# EasyEDA Pro project RUSH_PCB_roteada.epro

# Schematic Schematic1
Board Name: Board1; Create Date: 2026-11-04; Page Name: P1; Project Name: RUSH - corrigido; Schematic Name: Schematic1; Update Date: 2026-11-06; Company: EasyEDA.com; Drawn: Erick; Page Size: A4; Version: V1.0
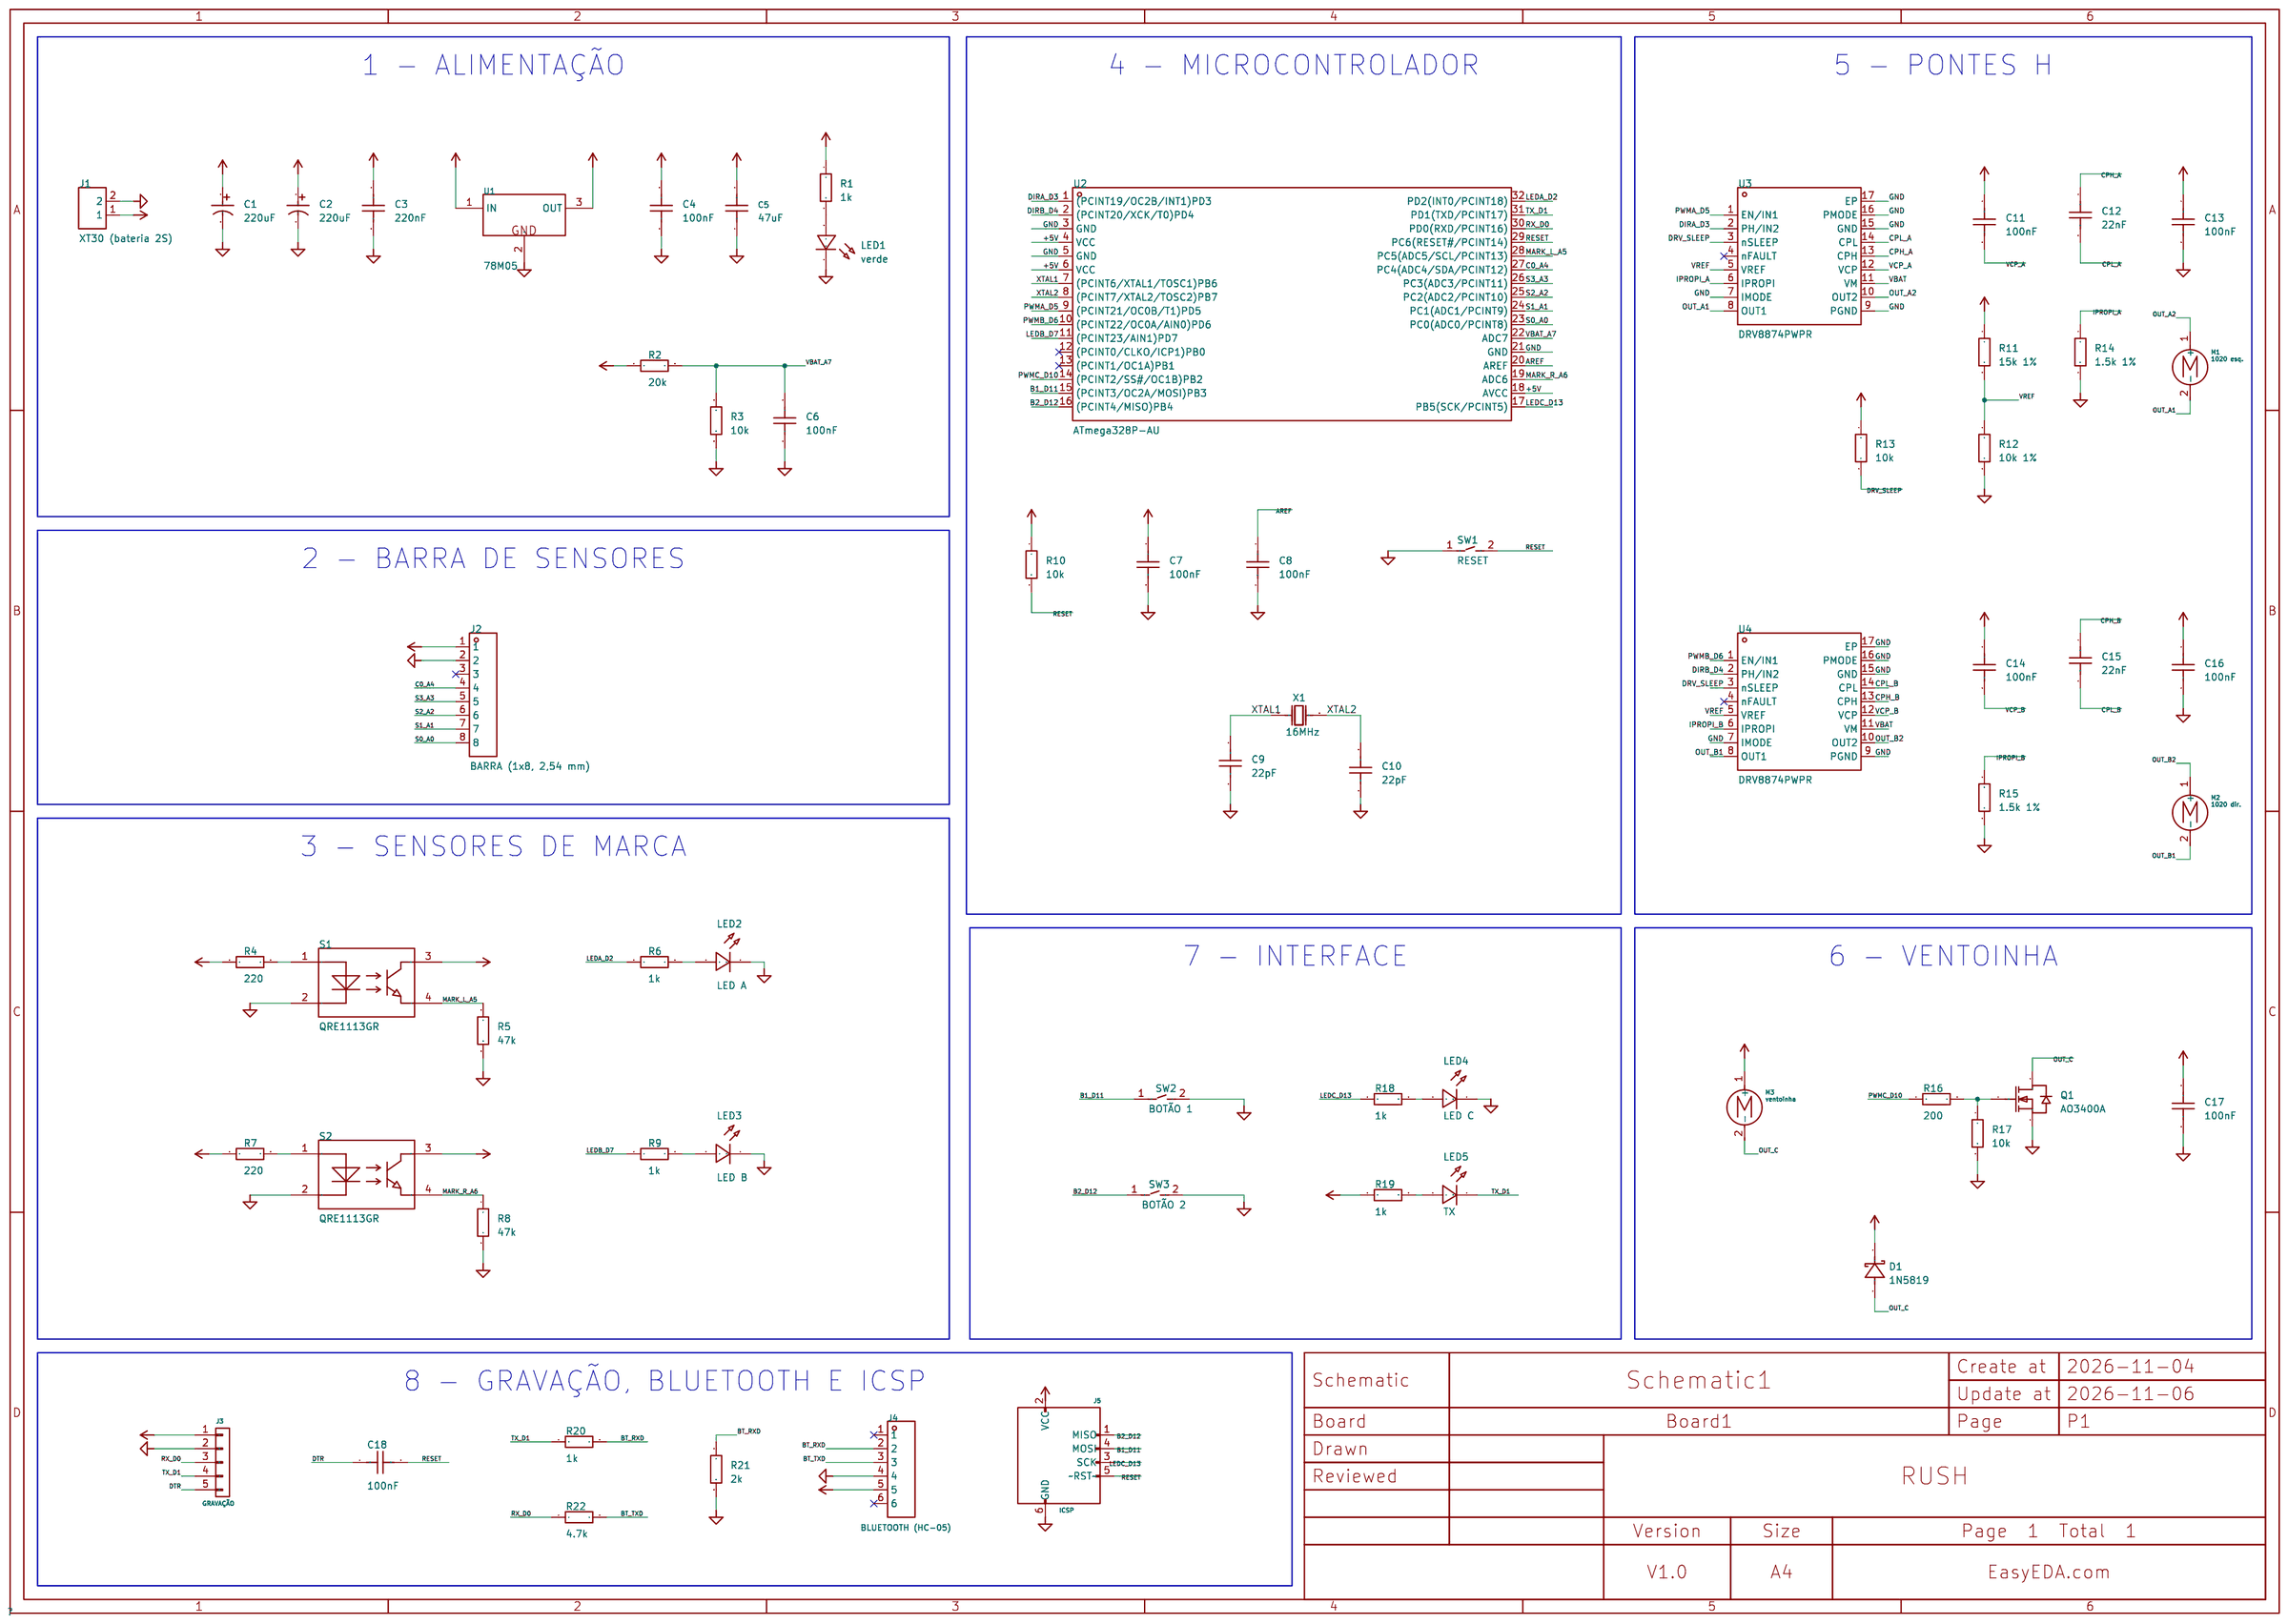
[diagram p0: schematic sheet]

## Parts
C1  220uF  [CAP-TH_BD6.3-P2.50-D1.0-FD]
C2  220uF  [CAP-TH_BD6.3-P2.50-D1.0-FD]
C3  220nF  [C0603]
C4  100nF  [C0603]
C5  47uF  [C1210]
C6  100nF  [C0603]
C7  100nF  [C0603]
C8  100nF  [C0603]
C9  22pF  [C0603]
C10  22pF  [C0603]
C11  100nF  [C0603]
C12  22nF  [C0603]
C13  100nF  [C0603]
C14  100nF  [C0603]
C15  22nF  [C0603]
C16  100nF  [C0603]
C17  100nF  [C0603]
C18  100nF  [C0603]
D1  1N5819  [SOD-123_L2.7-W1.6-LS3.7-RD-1]
J1  XT30 (bateria 2S)  [CONN-TH_XT30U-M]
J2  BARRA (1x8, 2,54 mm)  [HDR-TH_8P-P2.54-V-M]
J3  GRAVAÇÃO  [seguidor_alpha:HDR_1x05_P2.54_SMD_DEITADA]
J4  BLUETOOTH (femea 1x6, ordem HC-05)  [HDR-TH_6P-P2.54-V-F]
J5  ICSP  [seguidor_alpha:ICSP_6P_SMD_BOT]
LED1  verde  [LED0603-RD_GREEN]
LED2  LED A  [LED0603-RD_GREEN]
LED3  LED B  [LED0603-RD_GREEN]
LED4  LED C  [LED0603-RD_GREEN]
LED5  TX  [LED0603-RD_GREEN]
M1  1020 esq.  [seguidor_alpha:MOTOR_1020_2P]
M2  1020 dir.  [seguidor_alpha:MOTOR_1020_2P]
M3  ventoinha  [seguidor_alpha:MOTOR_1020_2P]
Q1  AO3400A  [SOT-23-3_L2.9-W1.3-P1.90-LS2.4-BR]
R1  1k  [R0603]
R2  20k 1%  [R0603]
R3  10k 1%  [R0603]
R4  220  [R0603]
R5  47k  [R0603]
R6  1k  [R0603]
R7  220  [R0603]
R8  47k  [R0603]
R9  1k  [R0603]
R10  10k  [R0603]
R11  15k 1%  [R0603]
R12  10k 1%  [R0603]
R13  10k  [R0603]
R14  1.5k 1%  [R0603]
R15  1.5k 1%  [R0603]
R16  200  [R0603]
R17  10k  [R0603]
R18  1k  [R0603]
R19  1k  [R0603]
R20  1k  [R0603]
R21  2k  [R0603]
R22  4.7k  [R0603]
S1  QRE1113GR  [OPTO-SMD_QRE1113GR]
S2  QRE1113GR  [OPTO-SMD_QRE1113GR]
SW1  RESET  [KEY-SMD_L6.1-W3.7-LS8.0-2]
SW2  BOTÃO 1  [KEY-SMD_L6.1-W3.7-LS8.0-2]
SW3  BOTÃO 2  [KEY-SMD_L6.1-W3.7-LS8.0-2]
U1  78M05  [TO-252-2_L6.5-W6.1-P4.58-LS10.0-TL]
U2  ATmega328P-AU  [TQFP-32_L7.0-W7.0-P0.80-LS9.0-BL]
U3  DRV8874PWPR  [HTSSOP-16_L5.0-W4.4-P0.65-LS6.4-BL-EP]
U4  DRV8874PWPR  [HTSSOP-16_L5.0-W4.4-P0.65-LS6.4-BL-EP]
X1  16MHz  [CRYSTAL-SMD_L5.0-W3.2]

## Library data of the parts
C1 C2 = KM221M025E110A: entre os pes da carcaca, como no EVA-RT; LCSC Part Name: 220uF ±20% 25V; Supplier Part: C59416; Manufacturer: CapXon(丰宾); Supplier Footprint: 插件,D6.3xL11mm; JLCPCB Part Class: Extended Part; Datasheet: https://item.szlcsc.com/datasheet/KM221M025E110A/60469.html; Supplier: LCSC; Tolerance: ±20%; Voltage Rating: 25V; Ripple Current: 235mA@120Hz; Pin Spacing: 2.5mm; Diameter: 6.3mm; Height - Seated (Max): 11mm; Lifetime: 2000hrs@105℃; Operating Temperature: -40℃~+105℃; Polarity type: Polarized; Encapsulamento: eletrolitico 25 V, radial D6,3 mm P2,5; DNP: no
C3 = CAP_0603: Supplier Footprint: 0603; Encapsulamento: 0603 50 V; DNP: no; Voltage Rating: 50V
C4 C9 C10 = CAP_0603: Supplier Footprint: 0603; Encapsulamento: 0603; DNP: no; Voltage Rating: 16V
C5 = GRM32ER61A476KE20L: Capacitance:47uF Tolerance:±10% Tolerance:±10% Voltage Rating:10V Temperature Coefficient:X5R; LCSC Part Name: 47uF ±10% 10V; Supplier Part: C397312; Manufacturer: muRata(村田); Supplier Footprint: 1210; JLCPCB Part Class: Extended Part; Datasheet: https://item.szlcsc.com/datasheet/GRM32ER61A476KE20L/378872.html; Supplier: LCSC; Tolerance: ±10%; Voltage Rating: 10V; Temperature Coefficient: X5R
C6 = CAP_0603: filtro da medicao (opcional); Supplier Footprint: 0603; Encapsulamento: 0603; DNP: no; Voltage Rating: 16V
C7 = CAP_0603: junto aos pinos VCC; Supplier Footprint: 0603; Encapsulamento: 0603; DNP: no; Voltage Rating: 16V
C8 = CAP_0603: AREF (referencia = AVCC no firmware); Supplier Footprint: 0603; Encapsulamento: 0603; DNP: no; Voltage Rating: 16V
C11 C14 = CAP_0603: VCP -> VM; Supplier Footprint: 0603; Encapsulamento: 0603 16 V X7R; DNP: no; Voltage Rating: 16V
C12 C15 = CAP_0603: CPH -> CPL (tensao >= VM); Supplier Footprint: 0603; Encapsulamento: 0603 50 V X7R; DNP: no; Voltage Rating: 50V
C13 C16 = CAP_0603: VM, junto ao pino 11; Supplier Footprint: 0603; Encapsulamento: 0603 25 V X7R; DNP: no; Voltage Rating: 25V
C17 = CAP_0603: Supplier Footprint: 0603; Encapsulamento: 0603 25 V; DNP: no; Voltage Rating: 25V
C18 = CAP_0603: reset automatico pelo DTR; Supplier Footprint: 0603; Encapsulamento: 0603; DNP: no; Voltage Rating: 16V
D1 = 1N5819HW: diodo de roda livre (novo; o EVA-RT nao tem); LCSC Part Name: 电压:40V 电流:1A; Supplier Part: C2905649; Manufacturer: TECH PUBLIC(台舟); Supplier Footprint: SOD-123; JLCPCB Part Class: Extended Part; Datasheet: https://item.szlcsc.com/datasheet/1N5819HW/3175946.html; Supplier: LCSC; Voltage - Forward(Vf@If): 900mV@3A; Voltage - DC Reverse(Vr): 40V; Current - Rectified: 1A; Reverse Leakage Current (Ir): 1mA@40V; Non-Repetitive Peak Forward Surge Current: 9A; Encapsulamento: SOD-123 (B5819W) ou 1N5819 nos terminais do motor; DNP: no
J1 = XT30U-M.G.B: pino 1 = +, pino 2 = -; LCSC Part Name: AMASS(艾迈斯)模插头锂电池插头电机控制器充电器电池接头连接器焊接 2芯锂电插头 黑色 公头15AXT30U-M.G.B; Supplier Part: C19268020; Manufacturer: AMASS(艾迈斯); JLCPCB Part Class: Extended Part; Datasheet: https://item.szlcsc.com/datasheet/XT30U-M.G.B/20526031.html; Supplier: LCSC; Encapsulamento: XT30PW-M de placa ou rabicho XT30; DNP: no
J2 = 2.54-1*8: Pin Structure:1x8P Pitch:2.54mm Circluar Pins/Square Pins:Pin Header Mounting Type:Through Hole Number of Rows:1 Number of Pins:8P Current Rating:2.5A Length of Mating Pin:6mm Insulation Height:2.54mm Length of End Connection Pin:3mm Contact Material:Bras; LCSC Part Name: 1x8P 间距:2.54mm 方针 直插; Supplier Part: C5156616; Manufacturer: ZHOURI(洲日); Supplier Footprint: 插件,P=2.54mm; JLCPCB Part Class: Extended Part; Datasheet: https://item.szlcsc.com/datasheet/2.54-1*8/5790716.html; Supplier: LCSC; Pin Structure: 1x8P; Pitch: 2.54mm; Circluar Pins/Square Pins: Pin Header; Mounting Type: Through Hole; Number of Rows: 1; Number of Pins: 8P; Current Rating: 2.5A; Length of Mating Pin: 6mm; Insulation Height: 2.54mm; Length of End Connection Pin: 3mm; Contact Material: Brass; Contact Plating: Gold; Operating Temperature: -40℃~+105℃; Encapsulamento: barra de pinos 1x8 2,54 mm; DNP: no
J3 = Connector_Generic_Conn_01x05: 1=+5V, 2=GND, 3=RX_D0, 4=TX_D1, 5=DTR. Face inferior no layout.; Encapsulamento: 5 pads SMD, passo 2,54 mm; montagem na face inferior; DNP: no
J4 = 2.54-1*6P母: frente direita, x = 32,5; HC-06 nas vias 2-5 (virado); LCSC Part Name: 1x6P 间距:2.54mm 直插; Supplier Part: C40877; Manufacturer: BOOMELE(博穆精密); Supplier Footprint: 插件,P=2.54mm; JLCPCB Part Class: Extended Part; Datasheet: https://item.szlcsc.com/datasheet/2.54-1*6P%25E6%25AF%258D/41861.html; Supplier: LCSC; Holes Structure: 1x6P; Pitch: 2.54mm; Circular Hole / Square Hole: Square Hole; Mounting Type: Through Hole; Number of Rows: 1; Number of Positions: 6P; Current Rating: 3A; Holes Direction: Top; Insulation Height: 8.5mm; Contact Material: Brass; Contact Plating: Gold; Operating Temperature: -40℃~+105℃; PIN Length: 3.2mm; Encapsulamento: barra femea 1x6 2,54 mm; DNP: no
J5 = Connector_AVR-ISP-6: posicoes do EVA-RT: x 33,97/36,51; y -8,36/-10,90/-13,44; Encapsulamento: 6 pads SMD D1,8 em grade 2,54; DNP: no
LED1 = LED_0603-G: indica 5 V presente; Encapsulamento: 0603; DNP: no
LED2 LED3 LED5 = LED_0603-G: Encapsulamento: 0603; DNP: no
LED4 = LED_0603-G: vermelho; o LED3 em paralelo do EVA-RT foi retirado; Encapsulamento: 0603; DNP: no
M1 M2 = Motor_Motor_DC: coreless 1020 7,4 V; se girar ao contrario, inverta os fios; Encapsulamento: 2 pads; DNP: no
M3 = Motor_Motor_DC: coreless 1020 7,4 V; Encapsulamento: 2 pads; DNP: no
Q1 = AO3400A_C20917: no lugar do IRFR3411/RM10N100LD; liga totalmente com 5 V no gate; LCSC Part Name: N沟道 耐压:30V; Supplier Part: C20917; Manufacturer: AOS; Supplier Footprint: SOT-23; JLCPCB Part Class: Basic Part; Datasheet: https://item.szlcsc.com/datasheet/AO3400A/21629.html; Supplier: LCSC; Number: 1 N-channel; Drain to Source Voltage: 30V; Current - Continuous Drain(Id): 5.7A; RDS(on): 48mΩ@2.5V; Pd - Power Dissipation: 1.4W; Gate Threshold Voltage (Vgs(th)): 1.45V; Gate Charge(Qg): 7nC@10V; Input Capacitance(Ciss): 630pF; Reverse Transfer Capacitance (Crss@Vds): 50pF; Operating Temperature: -55℃~+150℃; Type: N-Channel; Output Capacitance(Coss): 75pF; Vgs: ±12V; Encapsulamento: SOT-23 (1 = G, 2 = S, 3 = D); DNP: no
R1 R4-R9 R18 R19 = Res_0603: Supplier Footprint: 0603; Encapsulamento: 0603; DNP: no
R2 R3 = Res_0603: medicao da bateria (opcional); Supplier Footprint: 0603; Encapsulamento: 0603; DNP: no
R10 = Res_0603: EVA-RT usava 1k; 10k com reset automatico por DTR; Supplier Footprint: 0603; Encapsulamento: 0603; DNP: no
R11 R12 = Res_0603: VREF = 2,0 V; Supplier Footprint: 0603; Encapsulamento: 0603; DNP: no
R13 = Res_0603: nSLEEP sempre alto (pull-down interno de 100k); Supplier Footprint: 0603; Encapsulamento: 0603; DNP: no
R14 R15 = Res_0603: IPROPI -> limite de corrente; Supplier Footprint: 0603; Encapsulamento: 0603; DNP: no
R16 = Res_0603: gate; Supplier Footprint: 0603; Encapsulamento: 0603; DNP: no
R17 = Res_0603: gate -> GND (desligado no boot); Supplier Footprint: 0603; Encapsulamento: 0603; DNP: no
R20 R21 = Res_0603: divisor 5 V -> 3,3 V; Supplier Footprint: 0603; Encapsulamento: 0603; DNP: no
R22 = Res_0603: 4,7k: grava com o HC-05 encaixado (sem LED de RX); Supplier Footprint: 0603; Encapsulamento: 0603; DNP: no
S1 S2 = QRE1113GR: datasheet: 1 = anodo, 2 = catodo, 3 = coletor, 4 = emissor; LCSC Part Name: 微型反射式物体传感器; Supplier Part: C232862; Manufacturer: onsemi(安森美); Supplier Footprint: SMD-4P; JLCPCB Part Class: Extended Part; Datasheet: https://item.szlcsc.com/datasheet/QRE1113GR/232660.html; Supplier: LCSC; Sensing Distance: 1mm; Voltage - Forward(Vf): 1.2V; C-E Saturation Voltage: 30V; Current - Collector(Ic): 20mA; Reverse Pressure (Typ): 5V; Forward Current(If): 50mA; Wavelength: 940nm; Output Type: Phototransistor; Vce Saturation(VCE(sat)): 0.3V@If=20mA,Ic=50uA; Rise time: 20us@Vcc=5V,Ic=100uA,Rl=1kΩ; Fall time: 20us@Vcc=5V,Ic=100uA,Rl=1kΩ; Power Dissipation(Pd): 50mW; Operating Temperature: -40℃~+85℃; Encapsulamento: SMD 4 pinos; DNP: no
SW1-SW3 = TVBM17-025CF-R: Circuit:SPST Actuator Style:Rectangular Button Mounting Type:Surface Mount,Vertical Length:6.1mm Width:3.7mm Switch Height:2.5mm with Bracket:Without Bracket Contact Current:50mA Voltage Rating:12V With Lamp:No Termination Style:Gull Wing Operating Temper; LCSC Part Name: 一型/贴片/2.5H/250gf/黑底PPA白钮/防尘/编带; Supplier Part: C19271064; Manufacturer: jianfu(键富); Supplier Footprint: SMD,6.1x3.7mm; JLCPCB Part Class: Extended Part; Datasheet: https://item.szlcsc.com/datasheet/TVBM17-025CF-R/20539419.html; Supplier: LCSC; Circuit: SPST; Actuator Style: Rectangular Button; Mounting Type: Surface Mount,Vertical; Length: 6.1mm; Width: 3.7mm; Switch Height: 2.5mm; with Bracket: Without Bracket; Contact Current: 50mA; Voltage Rating: 12V; With Lamp: No; Termination Style: Gull Wing; Operating Temperature: -40℃~+85℃
U1 = 78M05_C111265: Output Configuration:Positive Voltage - Supply:35V Output Voltage:5V Output Voltage:5V Output Current:500mA Power Supply Rejection Ratio (PSRR):78dB@(120Hz) Voltage Dropout:2V@(500mA) standby current:6mA Noise:- Features:- Operating Temperature:-40℃~+125℃; LCSC Part Name: 5V 500mA 35V; Supplier Part: C111265; Manufacturer: SHIKUES(时科); Supplier Footprint: TO-252-2(DPAK); JLCPCB Part Class: Extended Part; Datasheet: https://item.szlcsc.com/datasheet/78M05/112491.html; Supplier: LCSC; Output Configuration: Positive; Voltage - Supply: 35V; Output Voltage: 5V; Output Current: 500mA; Power Supply Rejection Ratio (PSRR): 78dB@(120Hz); Voltage Dropout: 2V@(500mA); standby current: 6mA; Operating Temperature: -40℃~+125℃; Output Type: Fixed; Number of Outputs: 1; Encapsulamento: TO-252 (DPAK); DNP: no
U2 = ATMEGA328P-AU_C14877: do Nano/Uno doador (com bootloader) ou novo + bootloader pelo ICSP; LCSC Part Name: 基于AVR增强型RISC架构的低功耗CMOS 8位微控制器; Supplier Part: C14877; Manufacturer: MICROCHIP(美国微芯); Manufacturer Part: ATMEGA328P-AU; Supplier Footprint: TQFP-32(7x7); JLCPCB Part Class: Extended Part; Datasheet: https://item.szlcsc.com/datasheet/ATMEGA328P-AU/15549.html; Supplier: LCSC; CPU Core: AVR; CPU Maximum Speed: 20MHz; Core Size: 8 Bit; Program Storage Size: 32KB; Program Memory Type: FLASH; RAM Size: 2KB; EEPROM: 1KB; Number of I/O: 23; ADC (Bit): 10bit; Oscillator Type: Built-in; Voltage - Supply: 1.8V~5.5V; Operating Temperature: -40℃~+85℃; Features: External pin reset (NRST)；Built-in general-purpose timer；Power-on reset (POR)；Touch function；Undervoltage detection (BOR/LVD/LVR/LVI)；Programmable watchdog; Encapsulamento: TQFP-32; DNP: no
U3 = DRV8874PWPR: esq.; LCSC Part Name: 6A 有刷直流电机驱动芯片 4.5V~37V; Supplier Part: C1855818; Manufacturer: TI(德州仪器); Supplier Footprint: HTSSOP-16-EP; JLCPCB Part Class: Extended Part; Datasheet: https://www.ti.com/cn/lit/ds/symlink/drv8874.pdf; Supplier: LCSC; Technology: Yes; Number of H-bridges: 1; Peak Current: 6A; RDS(on): 200mΩ; Quiescent Current(Iq): 750nA; Operating Temperature: -40℃~+125℃; Features: Interleaved conduction protection；Current sensing/regulation function; Encapsulamento: HTSSOP-16 (PWP), pad termico com vias; DNP: no
U4 = DRV8874PWPR: dir.; LCSC Part Name: 6A 有刷直流电机驱动芯片 4.5V~37V; Supplier Part: C1855818; Manufacturer: TI(德州仪器); Supplier Footprint: HTSSOP-16-EP; JLCPCB Part Class: Extended Part; Datasheet: https://www.ti.com/cn/lit/ds/symlink/drv8874.pdf; Supplier: LCSC; Technology: Yes; Number of H-bridges: 1; Peak Current: 6A; RDS(on): 200mΩ; Quiescent Current(Iq): 750nA; Operating Temperature: -40℃~+125℃; Features: Interleaved conduction protection；Current sensing/regulation function; Encapsulamento: HTSSOP-16 (PWP), pad termico com vias; DNP: no
X1 = 7A-16.000MAAJ-T: Frequency:16MHz Normal temperature Frequency Tolerance:±30ppm Normal temperature Frequency Tolerance:±30ppm Load Capacitor: Frequency Stability(Full temperature range):±30ppm Frequency Stability(Full temperature range):±30ppm Equivalent Series Resistance; LCSC Part Name: 16MHz ±30ppm 18pF; Supplier Part: C2450102; Manufacturer: TXC(晶技); Supplier Footprint: SMD5032; JLCPCB Part Class: Extended Part; Datasheet: https://atta.szlcsc.com/upload/public/pdf/source/20180326/C97724_C4EFF7A16D0E132C961AD7AA14FCEEAA.pdf; Supplier: LCSC; Normal temperature Frequency Tolerance: ±30ppm; Frequency Stability(Full temperature range): ±30ppm; Equivalent Series Resistance (ESR): 50Ω

## Nets
+5V: C4.1 C5.2 C7.1 J2.1 J3.1(Pin) J4.5 J5.2(VCC) R1.1 R4.1 R7.1 R10.1 R11.1 R13.1 R19.1 S1.3(C) S2.3(C) U1.3(OUT) U2.4(VCC) U2.6(VCC) U2.18(AVCC)
GND: C1.2 C2.2 C3.2 C4.2 C5.1 C6.2 C7.2 C8.2 C9.2 C10.2 C13.2 C16.2 C17.2 J1.2 J2.2 J3.2(Pin) J4.4 J5.6(GND) LED1.1(C) LED2.1(C) LED3.1(C) LED4.1(C) Q1.2(S) R3.2 R5.2 R8.2 R12.2 R14.2 R15.2 R17.2 R21.2 S1.2 S2.2 SW1.1 SW2.2 SW3.2 U1.2(GND) U2.3(GND) U2.5(GND) U2.21(GND) U3.7(IMODE) U3.9(PGND) U3.15(GND) U3.16(PMODE) U3.17(EP) U4.7(IMODE) U4.9(PGND) U4.15(GND) U4.16(PMODE) U4.17(EP)
VBAT: C1.1 C2.1 C3.1 C11.1 C13.1 C14.1 C16.1 C17.1 D1.1(K) J1.1 M3.1(+) R2.1 U1.1(IN) U3.11(VM) U4.11(VM)
VBAT_A7: C6.1 R2.2 R3.1 U2.22(ADC7)
AREF: C8.1 U2.20(AREF)
B1_D11: J5.4(MOSI) SW2.1 U2.15((PCINT3/OC2A/MOSI)PB3)
B2_D12: J5.1(MISO) SW3.1 U2.16((PCINT4/MISO)PB4)
BT_RXD: J4.2 R20.2 R21.1
BT_TXD: J4.3 R22.2
C0_A4: J2.4 U2.27(PC4(ADC4/SDA/PCINT12))
CPH_A: C12.1 U3.13(CPH)
CPH_B: C15.1 U4.13(CPH)
CPL_A: C12.2 U3.14(CPL)
CPL_B: C15.2 U4.14(CPL)
DIRA_D3: U2.1((PCINT19/OC2B/INT1)PD3) U3.2(PH/IN2)
DIRB_D4: U2.2((PCINT20/XCK/T0)PD4) U4.2(PH/IN2)
DRV_SLEEP: R13.2 U3.3(nSLEEP) U4.3(nSLEEP)
DTR: C18.1 J3.5(Pin)
IPROPI_A: R14.1 U3.6(IPROPI)
IPROPI_B: R15.1 U4.6(IPROPI)
LEDA_D2: R6.1 U2.32(PD2(INT0/PCINT18))
LEDB_D7: R9.1 U2.11((PCINT23/AIN1)PD7)
LEDC_D13: J5.3(SCK) R18.1 U2.17(PB5(SCK/PCINT5))
MARK_L_A5: R5.1 S1.4(E) U2.28(PC5(ADC5/SCL/PCINT13))
MARK_R_A6: R8.1 S2.4(E) U2.19(ADC6)
OUT_A1: M1.2(-) U3.8(OUT1)
OUT_A2: M1.1(+) U3.10(OUT2)
OUT_B1: M2.2(-) U4.8(OUT1)
OUT_B2: M2.1(+) U4.10(OUT2)
OUT_C: D1.2(A) M3.2(-) Q1.3(D)
PWMA_D5: U2.9((PCINT21/OC0B/T1)PD5) U3.1(EN/IN1)
PWMB_D6: U2.10((PCINT22/OC0A/AIN0)PD6) U4.1(EN/IN1)
PWMC_D10: R16.1 U2.14((PCINT2/SS#/OC1B)PB2)
RESET: C18.2 J5.5(~RST~) R10.2 SW1.2 U2.29(PC6(RESET#/PCINT14))
RX_D0: J3.3(Pin) R22.1 U2.30(PD0(RXD/PCINT16))
S0_A0: J2.8 U2.23(PC0(ADC0/PCINT8))
S1_A1: J2.7 U2.24(PC1(ADC1/PCINT9))
S2_A2: J2.6 U2.25(PC2(ADC2/PCINT10))
S3_A3: J2.5 U2.26(PC3(ADC3/PCINT11))
TX_D1: J3.4(Pin) LED5.1(C) R20.1 U2.31(PD1(TXD/PCINT17))
VCP_A: C11.2 U3.12(VCP)
VCP_B: C14.2 U4.12(VCP)
VREF: R11.2 R12.1 U3.5(VREF) U4.5(VREF)
XTAL1: C9.1 U2.7((PCINT6/XTAL1/TOSC1)PB6) X1.1(OSC1)
XTAL2: C10.1 U2.8((PCINT7/XTAL2/TOSC2)PB7) X1.2(OSC2)
$1N2048: R4.2 S1.1
$1N2069: R7.2 S2.1
$1N2070: LED1.2(A) R1.2
$1N2073: LED2.2(A) R6.2
$1N2082: LED3.2(A) R9.2
$1N2129: LED4.2(A) R18.2
$1N2130: LED5.2(A) R19.2
$1N2219: Q1.1(G) R16.2 R17.1

Not connected (* = marked no-connect by the designer): J2 3*; J4 1* 6*; U2 12((PCINT0/CLKO/ICP1)PB0)* 13((PCINT1/OC1A)PB1)*; U3 4(nFAULT)*; U4 4(nFAULT)*

## Notes on the sheet
- 1 - ALIMENTAÇÃO
- 4 - MICROCONTROLADOR
- 5 - PONTES H
- 2 - BARRA DE SENSORES
- 3 - SENSORES DE MARCA
- 7 - INTERFACE
- 6 - VENTOINHA
- 8 - GRAVAÇÃO, BLUETOOTH E ICSP

# Board PCB1
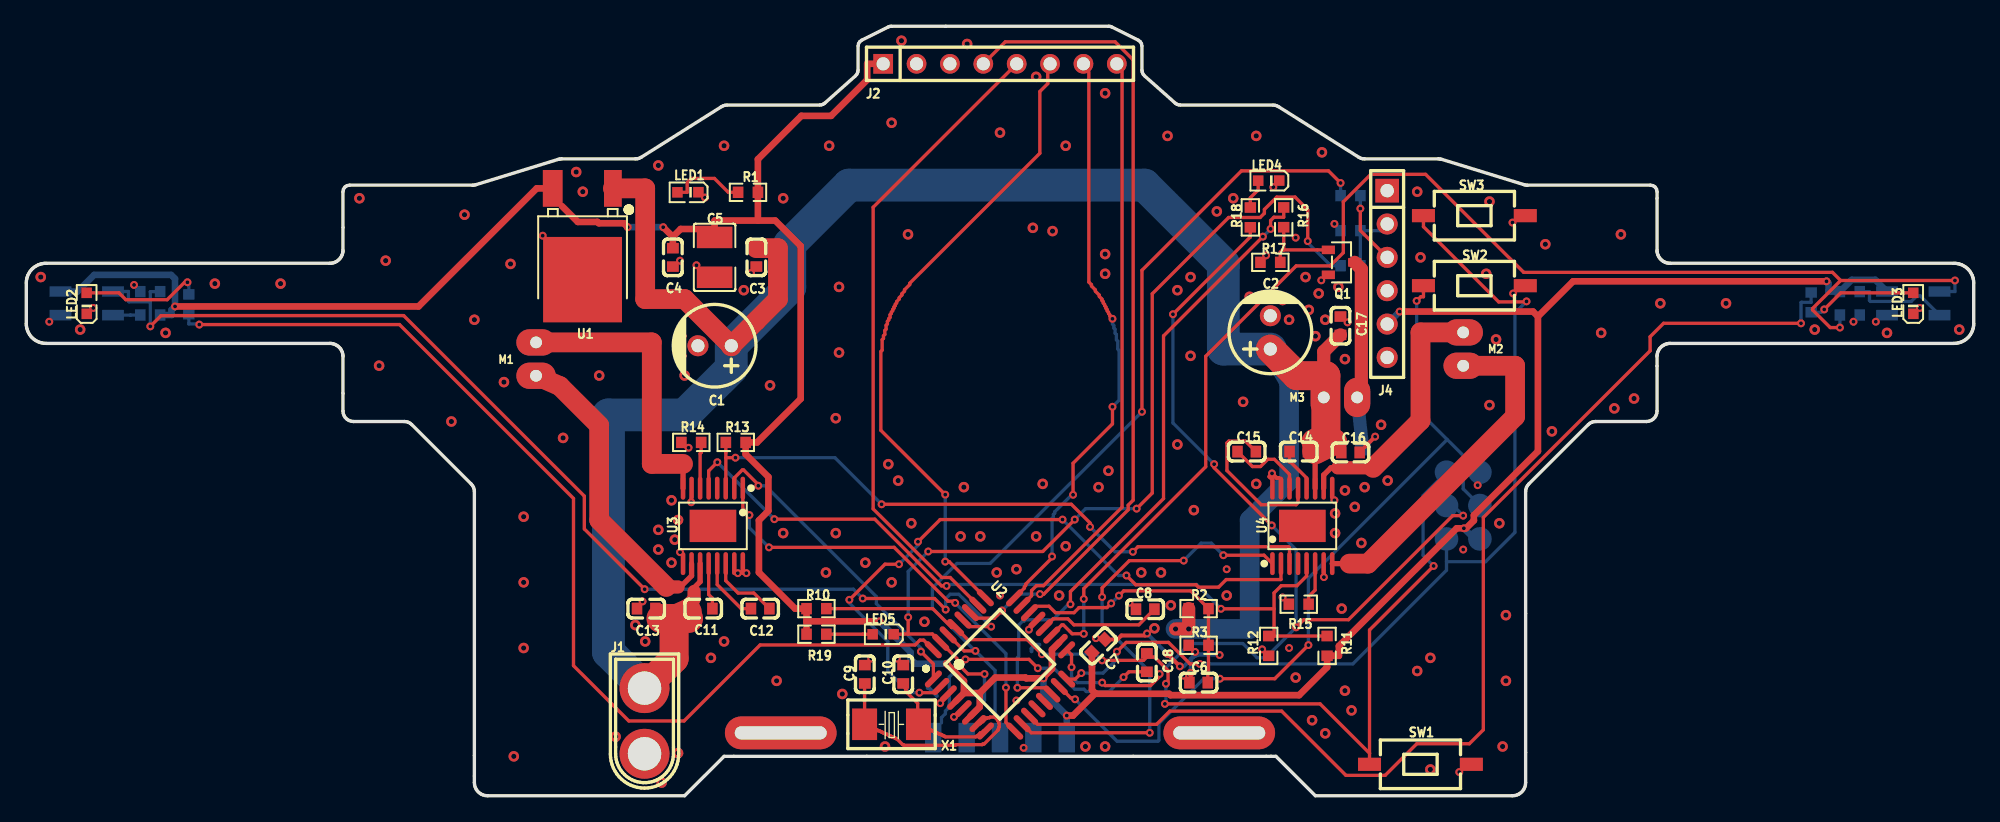
[diagram p1: board, top side]
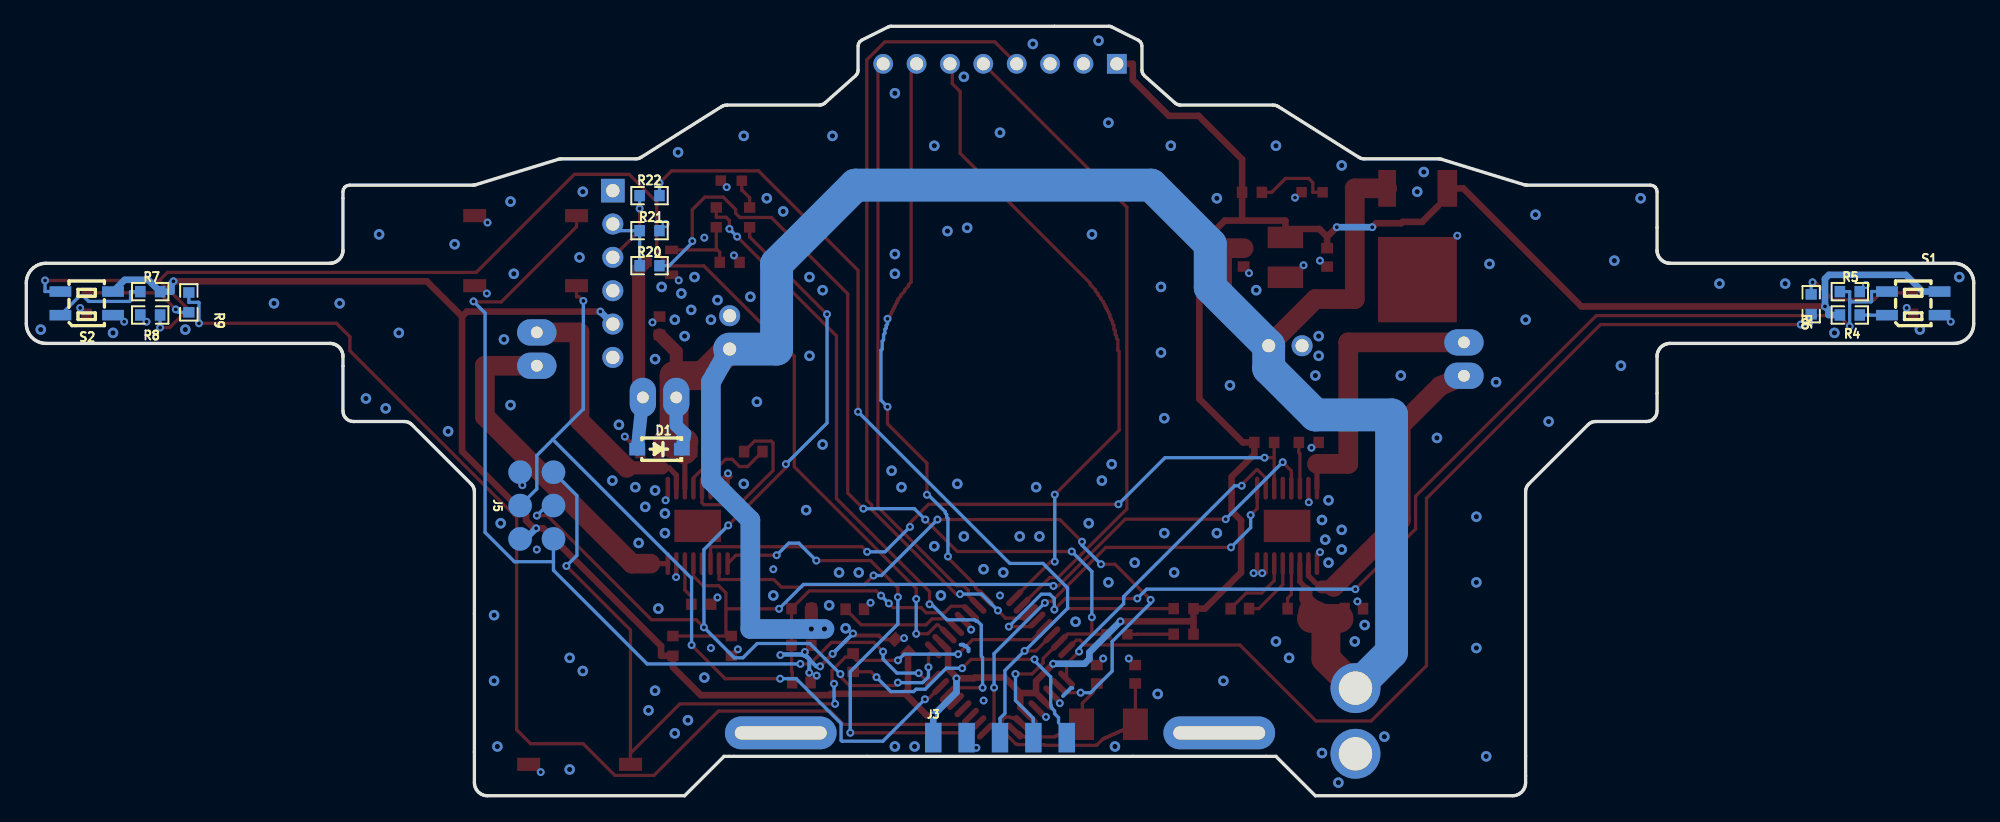
[diagram p2: board, bottom side, seen from below]

Outline 148.2 x 58.6 mm; copper layers: Top Layer, Bottom Layer. Coordinates in mm from the lower left corner of the outline.
Stack: Top Layer 0.035mm / Dielectric1 1.51mm FR4 er 4.5 / Bottom Layer 0.035mm

## Design rules (mm)
spacing copperThickness1oz (default): track to track 0.2, other pairs 0.2 to 0.3
spacing copperThickness2oz: track to track 0.203, other pairs 0.152 to 0.3
spacing Plane_innerPlane: track to track 0.102, other pairs 0.152 to 0.3
spacing Copper_copperRegion: track to track 0.102, other pairs 0.152 to 0.3
track width copperThickness1oz (default): min 0.25, default 0.25, max 3
track width copperThickness2oz: min 0.203, default 0.254, max 2.54
differential pair differentialPair (default): width min 0.127, default 0.254, max 2.54; gap min 0.152, default 0.152

## Placement (name value [footprint] x y rotation side)
C1  220uF  [CAP-TH_BD6.3-P2.50-D1.0-FD]  52.38 34.27 180 top
C2  220uF  [CAP-TH_BD6.3-P2.50-D1.0-FD]  94.67 35.29 90 top
C3  220nF  [C0603]  55.56 41 270 top
C4  100nF  [C0603]  49.2 41 270 top
C5  47uF  [C1210]  52.38 41 90 top
C6  100nF  [C0603]  89.21 8.62 180 top
C7  100nF  [C0603]  81.59 11.41 45 top
C8  100nF  [C0603]  85.15 14.2 180 top
C9  22pF  [C0603]  63.81 9.25 90 top
C10  22pF  [C0603]  66.73 9.25 90 top
C11  100nF  [C0603]  51.51 14.25 0 top
C12  22nF  [C0603]  55.85 14.25 0 top
C13  100nF  [C0603]  47.18 14.25 180 top
C14  100nF  [C0603]  96.83 26.21 180 top
C15  22nF  [C0603]  92.87 26.21 180 top
C16  100nF  [C0603]  100.77 26.14 0 top
C17  100nF  [C0603]  100.01 35.79 90 top
C18  100nF  [C0603]  85.28 10.14 90 top
D1  1N5819  [SOD-123_L2.7-W1.6-LS3.7-RD-1]  100.01 26.4 0 bottom
J1  XT30 (bateria 2S)  [CONN-TH_XT30U-M]  47.05 5.69 270 top
J2  BARRA (1x8, 2,54 mm)  [HDR-TH_8P-P2.54-V-M]  74.1 55.74 0 top
J3  GRAVAÇÃO  [seguidor_alpha:HDR_1x05_P2.54_SMD_DEITADA]  74.1 4.43 0 bottom
J4  BLUETOOTH (femea 1x6, ordem HC-05)  [HDR-TH_6P-P2.54-V-F]  103.56 39.73 270 top
J5  ICSP  [seguidor_alpha:ICSP_6P_SMD_BOT]  109.35 22.1 0 bottom
LED1  verde  [LED0603-RD_GREEN]  50.35 45.96 180 top
LED2  LED A  [LED0603-RD_GREEN]  4.6 37.5 90 top
LED3  LED B  [LED0603-RD_GREEN]  143.6 37.5 90 top
LED4  LED C  [LED0603-RD_GREEN]  94.55 46.84 180 top
LED5  TX  [LED0603-RD_GREEN]  65.21 12.3 180 top
M1  1020 esq.  [seguidor_alpha:MOTOR_1020_2P]  38.79 33.25 0 top
M2  1020 dir.  [seguidor_alpha:MOTOR_1020_2P]  109.35 34.02 180 top
M3  ventoinha  [seguidor_alpha:MOTOR_1020_2P]  100.01 30.33 270 top
NOREF  -  [Pad_e558]  57.41 4.79 270 top
NOREF#2  -  [Pad_e557]  90.78 4.79 270 top
Q1  AO3400A  [SOT-23-3_L2.9-W1.3-P1.90-LS2.4-BR]  100.09 40.62 180 top
R1  1k  [R0603]  54.92 45.95 180 top
R2  20k 1%  [R0603]  89.21 14.25 0 top
R3  10k 1%  [R0603]  89.21 11.46 180 top
R4  220  [R0603]  9.43 36.61 180 bottom
R5  47k  [R0603]  9.43 38.39 180 bottom
R6  1k  [R0603]  12.37 37.43 90 bottom
R7  220  [R0603]  138.77 38.39 0 bottom
R8  47k  [R0603]  138.77 36.61 0 bottom
R9  1k  [R0603]  135.83 37.57 270 bottom
R10  10k  [R0603]  60.13 14.25 0 top
R11  15k 1%  [R0603]  98.99 11.41 90 top
R12  10k 1%  [R0603]  94.55 11.41 270 top
R13  10k  [R0603]  53.99 26.91 180 top
R14  1.5k 1%  [R0603]  50.6 26.91 180 top
R15  1.5k 1%  [R0603]  96.83 14.58 180 top
R16  200  [R0603]  95.69 44.05 270 top
R17  10k  [R0603]  94.67 40.62 180 top
R18  1k  [R0603]  93.15 44.04 90 top
R19  1k  [R0603]  60.13 12.3 0 top
R20  1k  [R0603]  100.77 40.37 0 bottom
R21  2k  [R0603]  100.77 43.03 180 bottom
R22  4.7k  [R0603]  100.77 45.7 0 bottom
S1  QRE1113GR  [OPTO-SMD_QRE1113GR]  4.6 37.5 180 bottom
S2  QRE1113GR  [OPTO-SMD_QRE1113GR]  143.6 37.5 180 bottom
SW1  RESET  [KEY-SMD_L6.1-W3.7-LS8.0-2]  106.1 2.39 180 top
SW2  BOTÃO 1  [KEY-SMD_L6.1-W3.7-LS8.0-2]  110.2 38.84 0 top
SW3  BOTÃO 2  [KEY-SMD_L6.1-W3.7-LS8.0-2]  110.2 44.18 0 top
U1  78M05  [TO-252-2_L6.5-W6.1-P4.58-LS10.0-TL]  42.35 42.78 270 top
U2  ATmega328P-AU  [TQFP-32_L7.0-W7.0-P0.80-LS9.0-BL]  74.1 10 315 top
U3  DRV8874PWPR  [HTSSOP-16_L5.0-W4.4-P0.65-LS6.4-BL-EP]  52.25 20.55 180 top
U4  DRV8874PWPR  [HTSSOP-16_L5.0-W4.4-P0.65-LS6.4-BL-EP]  97.11 20.55 0 top
X1  16MHz  [CRYSTAL-SMD_L5.0-W3.2]  65.84 5.44 0 top

## Footprints (pads in the part's own frame, mm; a bottom-side part is the same pattern mirrored in y, then rotated)
C0603
  rect 0.8x0.9 smd: 1(-0.7,0) 2(0.7,0)
C1210
  rect 1.635x2.7 smd: 1(-1.518,0) 2(1.518,0)
CAP-TH_BD6.3-P2.50-D1.0-FD
  round 1.6 hole 1: 1(-1.27,0) 2(1.27,0)
CONN-TH_XT30U-M
  round 3.8 hole 2.54: 1(-2.5,0) 2(2.5,0)
CRYSTAL-SMD_L5.0-W3.2
  rect 1.9x2.4 smd: 1(-2.05,0) 2(2.05,0)
HDR-TH_6P-P2.54-V-F
  rect 1.8x1.8 hole 1.02: 1(-6.35,0)
  round 1.6 hole 1.02: 2(-3.81,0) 3(-1.27,0) 4(1.27,0) 5(3.81,0) 6(6.35,0)
HDR-TH_8P-P2.54-V-M
  rect 1.5x1.5 hole 1: 1(-8.89,0)
  round 1.5 hole 1: 2(-6.35,0) 3(-3.81,0) 4(-1.27,0) 5(1.27,0) 6(3.81,0) 7(6.35,0) 8(8.89,0)
HTSSOP-16_L5.0-W4.4-P0.65-LS6.4-BL-EP
  oval 0.343x1.746 smd: 1(-2.275,-2.873) 2(-1.625,-2.873) 3(-0.975,-2.873) 4(-0.325,-2.873) 5(0.325,-2.873) 6(0.975,-2.873) 7(1.625,-2.873) 8(2.275,-2.873) 9(2.275,2.873) 10(1.625,2.873) 11(0.975,2.873) 12(0.325,2.873) 13(-0.325,2.873) 14(-0.975,2.873) 15(-1.625,2.873) 16(-2.275,2.873)
  rect 3.55x2.46 smd: 17(0,0)
KEY-SMD_L6.1-W3.7-LS8.0-2
  rect 1.75x1 smd: 1(-3.875,0) 2(3.875,0)
LED0603-RD_GREEN
  rect 0.8x0.8 smd: 1(-0.799,-0.004) 2(0.799,0.004)
OPTO-SMD_QRE1113GR
  rect 1.66x0.8 smd: 1(-2,-0.9) 2(2,-0.9) 3(2,0.9) 4(-2,0.9)
Pad_e557
  oval 2.5x8.5 hole 1x7: 1(0,0)
Pad_e558
  oval 2.5x8.5 hole 1x7: 1(0,0)
R0603
  rect 0.806x0.864 smd: 1(-0.753,0) 2(0.753,0)
seguidor_alpha:HDR_1x05_P2.54_SMD_DEITADA
  rect 1.25x2.25 smd: 1(5.08,0) 2(2.54,0) 3(0,0) 4(-2.54,0) 5(-5.08,0)
seguidor_alpha:ICSP_6P_SMD_BOT
  round 1.8 smd: 1(-1.27,2.54) 2(1.27,2.54) 3(-1.27,0) 4(1.27,0) 5(-1.27,-2.54) 6(1.27,-2.54)
seguidor_alpha:MOTOR_1020_2P
  oval 3x2 hole 0.9: 1(0,-1.27) 2(0,1.27)
SOD-123_L2.7-W1.6-LS3.7-RD-1
  rect 1.2x0.95 smd: 1(-1.7,0) 2(1.7,0)
SOT-23-3_L2.9-W1.3-P1.90-LS2.4-BR
  rect 1x0.65 smd: 1(1,-0.95) 2(1,0.95) 3(-1,0)
TO-252-2_L6.5-W6.1-P4.58-LS10.0-TL
  rect 2.8x1.35 smd: 1(-3.475,2.29)
  rect 6.5x6 smd: 2(3.475,-0.017)
  rect 2.8x1.5 smd: 3(-3.475,-2.29)
TQFP-32_L7.0-W7.0-P0.80-LS9.0-BL
  oval 0.45x1.65 smd: 1(-2.8,-4.369) 2(-2,-4.369) 3(-1.2,-4.369) 4(-0.4,-4.369) 5(0.4,-4.369) 6(1.2,-4.369) 7(2,-4.369) 8(2.8,-4.369) 17(2.8,4.369) 18(2,4.369) 19(1.2,4.369) 20(0.4,4.369) 21(-0.4,4.369) 22(-1.2,4.369) 23(-2,4.369) 24(-2.8,4.369)
  oval 1.65x0.45 smd: 9(4.381,-2.8) 10(4.381,-2) 11(4.381,-1.2) 12(4.381,-0.4) 13(4.381,0.4) 14(4.381,1.2) 15(4.381,2) 16(4.381,2.8) 25(-4.381,2.8) 26(-4.381,2) 27(-4.381,1.2) 28(-4.381,0.4) 29(-4.381,-0.4) 30(-4.381,-1.2) 31(-4.381,-2) 32(-4.381,-2.8)

## Nets
As in the schematic.

Pads without a net: J2 3; J4 1 6; NOREF 1; NOREF#2 1; U2 12 13; U3 4; U4 4

## Via types
v1: diameter 0.8, hole 0.4, Top Layer to Bottom Layer, 150 vias
v2: diameter 0.6, hole 0.3, Top Layer to Bottom Layer, 148 vias

## Routing (per net, layer and track width the routed paths; a pad name or vN(x,y) marks a point on that pad's centre or on a via; arc(x,y) is an arc through that point)
+5V: length 255.2
  Top Layer w0.5: v2(79.18,6.11) 79.66,6.11 81.35,7.8 ; 81.35,7.8 81.1,8.05 C7.1 ; 81.35,7.8 81.39,7.76 86.97,7.76 87.07,7.66 96.86,7.66 98.99,9.79 R11.1 99.89,10.66 99.89,11.4 108.85,20.37 v2(109.4,20.37) 109.57,20.37 110.16,20.96 110.16,21.36 115.04,26.24 115.04,36.5 ; v2(45.77,43.3) 45.47,43.6 43.57,43.6 43.47,43.7 41.97,43.7 40.77,44.9 ; U2.18 78.05,11.12 78.05,9.67 77.37,8.98 ; v2(104.51,36.87) 114.67,36.87 115.04,36.5 ; 115.04,36.5 117.72,39.18 v2(137,39.18) ; 55.68,43.8 57,43.8 58.93,41.87 58.93,30.23 55.61,26.91 R13.1 54.74,26.01 56.47,24.28 56.47,21.69 55.75,20.97 55.75,17 58.51,14.25 R10.1 59.38,13.28 ; 55.68,43.8 R1.1 55.68,48.47 58.98,51.78 61.25,51.78 63.99,54.52 63.99,55.74 J2.1 ; 55.68,43.8 52.38,43.8 52.38,43.16 ; 71.35,7.82 71.35,8.74 70.05,10.04 v2(70.05,10.05) ; 71.35,7.82 U2.4 ; 71.35,7.82 72.56,7.82 ; 77.37,8.98 v2(77.41,8.94) ; 77.37,8.98 77.33,8.94 76.09,8.94 76.04,9 73.74,9 72.56,7.82 ; v2(48.47,43.3) 49.07,42.7 ; C4.1 49.2,42.57 49.8,43.16 52.38,43.16 ; 52.38,43.16 52.38,42.52 ; 59.38,13.28 v2(64.94,13.28) ; 59.38,13.28 R19.1 ; v2(11.32,37.26) 29.85,37.26 38.84,46.25 U1.3 ; 72.56,7.82 72.56,6.76 U2.6
  Bottom Layer w0.5: v2(104.51,36.87) J4.5 ; v2(109.4,20.37) 110.21,19.56 J5.2 ; v2(45.77,43.3) v2(48.47,43.3) ; v2(137,39.18) 137.15,39.03 137.15,38.39 R7.1 138.92,39.29 140.71,39.29 S2.3 ; S1.3 3.9,38.4 5.16,39.67 11.02,39.67 11.32,39.37 v2(11.32,37.26) 11.05,37 11.05,36.61 R4.1 ; v2(70.05,10.05) 67.67,10.05 67.3,10.42 67.3,10.92 v2(64.94,13.28) ; J3.1 v2(79.18,6.11) 77.41,7.87 v2(77.41,8.94)
GND: length 23.1
  Top Layer w0.3: 100.45,36.1 100.5,36.1 v2(100.55,36.05) ; 81.5,11.95 81.45,11.95 v2(81.4,12) ; 94.15,11.05 v2(94.05,11.15) ; 49.85,18.45 v2(49.75,18.55) ; 5,37.1 5.05,37.1 v2(5.1,37.15) ; 88.15,9.05 v2(88.05,9.15) ; 82.64,11.91 83.04,11.91 83.34,12.2 85.14,12.2 v2(85.29,12.36) ; 46.85,14.7 46.85,14.75 v2(46.9,14.8) ; 95.7,15 v2(95.6,15.1) ; 70.7,6.1 v2(70.6,6) ; 99.5,22.6 99.5,22.55 v2(99.55,22.5) ; 113.2,38.35 113.2,38.3 v2(113.15,38.25) ; v2(64.3,10.45) 64.25,10.4 64.25,10.35 ; 66.3,10.35 66.3,10.4 v2(66.25,10.45) ; v2(144.1,37.15) 144.05,37.1 144,37.1 ; 49.65,40.7 49.7,40.7 v2(49.75,40.75) ; 95.35,24.2 95.15,24.2 v2(94.8,24.55) 94.6,24.3 94.7,24.2 ; 94.95,46.45 94.95,46.4 v2(94.9,46.35) ; 50.6,22.6 v2(50.6,22.35) ; 54.05,17 54.1,17 v2(54.15,16.95) ; v2(54.8,16.95) 54.75,17 54.7,17 ; v2(51,40.4) 51.05,40.35 51.05,40.3 ; v2(51.65,45.55) 51.6,45.6 51.55,45.6 ; 101.85,26.55 v2(102.65,27.35) ; 98.75,16.85 v2(98.75,16.65) ; 50.25,26.5 v2(50.4,26.5) ; 113.2,43.7 113.15,43.7 v2(113.1,43.65) ; v2(39.3,42.65) 39.35,42.6 39.35,42.55 ; 109.1,1.9 109.1,1.85 v2(109.05,1.8) ; 88.85,11.05 v2(88.95,10.95) ; 55.15,39.95 v2(55.15,39.8) ; 94.3,41.05 94.3,41.1 v2(94.35,41.15) ; 76.4,12.75 v2(76.3,12.65) ; 84.05,14.65 84,14.65 v2(83.95,14.7) ; v2(98.55,39.25) 98.6,39.3 98.6,39.35 ; v2(86.84,10.81) v2(87.79,9.86) ; 88.61,9.02 v2(88.61,9.37) ; 69.65,7.15 v2(69.55,7.05)
  Bottom Layer w0.3: 99.65,43.45 v2(99.55,43.55) ; 1.8,36.2 1.8,36.15 v2(1.75,36.1) ; v2(87.79,9.86) 88.09,9.86 88.89,10.66 88.94,10.66 88.99,10.7 89.09,10.7 89.14,10.75 90.74,10.75 v2(90.81,10.72) 90.76,10.77 89.21,10.77 89.16,10.72 89.01,10.72 88.96,10.67 88.91,10.67 88.81,10.57 88.76,10.57 88.61,10.42 v2(88.61,9.37) ; 76.05,3.65 v2(75.9,3.65) ; 140.8,36.2 140.8,36.15 v2(140.75,36.1) ; 76.5,11 76.5,11.2 76.7,11.4 76.8,11.4 76.9,11.5 77.1,11.5 ; 8.3,38.8 v2(8.2,38.9) ; v2(85.29,12.36) v2(86.84,10.81) ; v2(110.45,23.65) 110.5,23.7 110.5,23.75 ; 139.15,36.2 v2(139.05,36.1) ; 69.3,7.6 68.7,8.2 68.6,8.2
  vias: v1(1.1,39.5) v1(4.1,35.5) v1(10.6,35.25) v1(14.35,39) v1(19.35,39) v1(25.35,45.5) v1(26.85,32.75) v1(27.35,40.75) v1(32.35,28.5) v1(33.35,44.25) v1(34.1,36.25) v1(36.35,31.5) v1(36.85,40.5) v1(37.1,3) v1(37.85,21.25) v1(37.85,16.25) v1(37.85,11.25) v1(40.85,27.25) v1(41.85,47.5) v1(42.35,46) v1(43.6,32) v1(44.85,4.5) v1(46.35,13) v1(47.1,11.75) v1(48.1,48) v1(48.1,20.25) v1(48.1,18.75) v1(48.35,1) v1(49.1,22.5) v1(49.1,17.75) v1(49.35,19.5) v1(49.6,21) v1(49.6,3.25) v1(49.85,35) v1(49.85,33.5) v1(50.1,32) v1(52.1,10.5) v1(53.1,49.5) v1(53.1,11.75) v1(54.6,38.5) v1(56.6,31.25) v1(57.1,8.75) v1(57.6,45.5) v1(57.6,20) v1(60.85,17) v1(61.1,49.5) v1(61.6,28.75) v1(61.6,20) v1(61.85,38.75) v1(61.85,33.75) v1(62.1,7.75) v1(63.85,17.75) v1(65.35,3.75) v1(65.6,25.25) v1(65.85,51.25) v1(65.85,16.25) v1(66.35,24) v1(66.6,57.5) v1(67.1,42.75) v1(67.35,20.75) v1(68.35,13.25) v1(71.1,19.75) v1(71.35,23.5) v1(71.6,57.25) v1(72.6,19.75) v1(73.85,17) v1(74.1,50.5) v1(75.35,17.25) v1(76.6,43.25) v1(76.85,54.75) v1(76.85,19.75) v1(77.35,23.75) v1(78.1,43) v1(78.6,15.25) v1(79.1,49.5) v1(79.1,19) v1(80.6,3.75) v1(81.6,23.5) v1(82.1,53.5) v1(82.1,41.25) v1(82.1,39.75) v1(82.1,3.75) v1(82.35,24.75) v1(84.85,17) v1(85.85,12.75) v1(86.35,17) v1(86.85,50.25) v1(87.1,14.5) v1(87.6,38.5) v1(87.6,26.75) v1(88.6,39.5) v1(88.6,33.5) v1(88.85,21.75) v1(90.6,44.5) v1(91.35,15.25) v1(91.85,45.5) v1(92.6,30) v1(93.1,38) v1(93.6,50.25) v1(93.6,23.75) v1(95.6,37.75) v1(96.1,36.25) v1(96.6,9) v1(97.35,39.5) v1(97.6,37) v1(97.85,5.75) v1(98.1,35) v1(98.35,38.25) v1(98.6,49) v1(98.85,36.25) v1(98.85,4.75) v1(99.6,21.5) v1(99.6,20) v1(99.85,38.75) v1(100.1,14.25) v1(100.35,33.25) v1(100.35,23.25) v1(100.35,8) v1(100.85,6.5) v1(101.1,22) v1(101.6,19.25) v1(101.85,23.5) v1(103.1,28.25) v1(103.6,24) v1(105.85,46) v1(105.85,9.5) v1(106.1,41) v1(106.85,10.5) v1(106.85,2) v1(111.1,39.75) v1(111.35,45.25) v1(111.35,29.75) v1(111.85,34.75) v1(112.1,20.75) v1(112.35,3.75) v1(112.6,13.75) v1(112.6,8.75) v1(115.6,42) v1(116.1,27.75) v1(119.85,35.25) v1(120.85,29.5) v1(121.35,42.75) v1(122.35,30.25) v1(124.35,37.5) v1(129.35,37.5) v1(136.1,35.5) v1(141.6,35.25) v1(147.1,35.5) v2(74.1,15.25) v2(75.35,7.25) v2(91.35,17.25) v2(96.1,11.25) v2(96.6,42.5) v2(109.35,18.75)
VBAT: length 192
  Top Layer w0.4: U3.11 51.28,16.3 50.82,15.84 50.82,15.55 ; U4.11 98.08,25.6
  Top Layer w1: v1(87.46,12.7) v1(88.46,12.7) R2.1 ; 50.4,14 50.4,14.58 50.82,15 50.82,15.55 ; C17.1 98.74,33.82 M3.1 98.9,31.99
  Top Layer w1.5: 55.56,41.7 57.2,41.7 57.2,37.82 C1.1 50.1,37.82 47.1,37.82 47.1,46.25 U1.1
  Top Layer w2: 50.4,14 49.3,13.5 ; 98.05,26.95 99.5,26.95 98.1,26.25
  Top Layer w2.2: C2.1 96.7,31.99 98.9,31.99 98.9,27.05 ; 49.3,13.5 49.3,10.45 J1.1 ; 48.3,13.5 50.4,13.5
  Bottom Layer w1: M3.1 98.74,28.2 98.1,27.56 D1.1
  Bottom Layer w1.5: C2.1 96.1,31.5 96.1,24 93.1,21 93.1,12.7 v1(88.46,12.7) v1(87.46,12.7)
  Bottom Layer w2.5: J1.1 44.3,10.94 44.3,29 50.1,29 53.65,32.55 C1.1 58.1,38.72 58.1,42 62.6,46.5 85.1,46.5 91.1,40.5 91.1,34.02 C2.1
VBAT_A7: length 20.9
  Top Layer w0.25: C6.1 89.91,9.41 89.97,9.46 R3.1 R2.2 88.62,15.6 83.51,15.6 v2(83.15,15.24) ; v2(82.56,14.65) 82.24,14.33 80.12,14.33 79.73,13.94 78.32,13.94 77.83,14.43 76.83,14.43 U2.22
  Bottom Layer w0.25: v2(83.15,15.24) v2(82.56,14.65)
AREF: length 9.3
  Top Layer w0.25: C8.1 84.66,13.02 79.72,13.02 79.27,13.47 78.14,13.47 U2.20
B1_D11: length 63.6
  Top Layer w0.25: v2(90.83,8.91) 95.01,8.91 v2(97.57,11.47) ; SW2.1 106.32,38 106.12,38 v2(105.81,37.68) ; v2(79.81,7.35) 79.71,7.45 79.71,7.45 79.48,7.45 U2.15
  Bottom Layer w0.25: v2(97.57,11.47) 97.57,16.56 108.13,27.13 ; 108.13,27.13 109.35,25.91 109.35,23.37 J5.4 ; 108.13,27.13 105.81,29.45 v2(105.81,37.68) ; v2(79.81,7.35) 83.01,4.15 86.12,4.15 86.19,4.22 86.19,5.5 89.61,8.91 v2(90.83,8.91)
B2_D12: length 71.6
  Top Layer w0.25: v2(80.29,9.34) 79.83,8.88 U2.16 ; v2(89.3,10.04) 88.56,10.04 86.92,11.68 83.7,11.68 v2(83,10.97) ; v2(114.17,37.65) 114.13,37.61 112.05,37.61 106.32,43.33 SW3.1
  Bottom Layer w0.25: 108.08,17.82 108.08,17.17 100.95,10.04 v2(89.3,10.04) ; 108.08,17.82 J5.1 ; 108.08,17.82 111.05,17.82 113.28,20.05 113.28,36.76 v2(114.17,37.65) ; v2(83,10.97) 83,10.4 81.94,9.34 v2(80.29,9.34)
BT_RXD: length 4.9
  Bottom Layer w0.25: R20.2 R21.1 103.06,43.03 J4.2
BT_TXD: length 5.5
  Top Layer w0.25: J4.3 101.52,43.04 v2(101.52,44.72)
  Bottom Layer w0.25: v2(101.52,44.72) R22.2
C0_A4: length 62.7
  Top Layer w0.25: J2.4 74.5,57.41 82.86,57.41 84.24,56.04 84.24,22.51 83.86,22.13 83.86,21.78 77.43,15.36 v2(77.14,15.36) ; 71.85,13.95 72.27,13.52 73.67,13.52 v2(74.26,14.11)
  Bottom Layer w0.25: v2(74.26,14.11) 75.51,15.36 v2(77.14,15.36)
CPH_A: length 4.9
  Top Layer w0.25: C12.1 54.41,14.25 52.58,16.08 52.58,17.68
CPH_B: length 12.3
  Top Layer w0.25: 96.78,23.42 96.78,22.32 96.63,22.17 93.97,22.17 91.37,24.76 91.37,26.87 91.51,27.01 92.78,27.01 C15.1
CPL_A: length 5.5
  Top Layer w0.25: U3.14 53.23,16.38 54.17,15.44 55.36,15.44 C12.2
CPL_B: length 6.2
  Top Layer w0.25: U4.14 96.13,24.47 94.98,25.62 94.47,25.62 93.92,25.07 93.31,25.07 C15.2
DIRA_D3: length 24
  Top Layer w0.25: U3.2 53.88,24.2 54.49,24.81 54.59,24.81 55.71,23.69 v2(55.71,23.61) ; 69.03,8.89 69.03,10.03 v2(68.08,10.98)
  Bottom Layer w0.25: v2(68.08,10.98) 68.08,11.23 64.69,14.62 64.69,15.16 56.24,23.61 v2(55.71,23.61)
DIRB_D4: length 50.7
  Top Layer w0.25: v2(66.42,17.63) 65.35,17.63 v2(62.64,14.92) ; v2(83.72,16.77) 84.43,16.07 89.02,16.07 89.2,15.89 90.74,15.89 91.31,16.46 95.47,16.46 95.48,16.48 95.48,17.68 ; v2(78.86,21.03) 69.55,21.03 v2(67.86,19.34) ; U2.2 69.12,7.85 v2(67.96,7.85)
  Bottom Layer w0.25: v2(66.42,17.63) 67.86,19.08 v2(67.86,19.34) ; v2(62.64,14.92) 62.64,14.67 65.56,11.75 65.56,9.5 67.21,7.85 v2(67.96,7.85) ; v2(83.72,16.77) 83.12,16.77 v2(78.86,21.03)
DRV_SLEEP: length 50.9
  Top Layer w0.25: U4.3 96.13,18.89 96.06,18.96 84.6,18.96 v2(84.21,18.58) ; v2(65.09,22.2) 79.53,22.2 80.95,20.77 v2(80.95,20.47) ; 53.24,25.74 53.24,23.43 U3.3 ; 53.24,25.74 R13.2 ; 53.24,25.74 v2(53.97,25.74)
  Bottom Layer w0.25: v2(53.97,25.74) 61.54,25.74 v2(65.09,22.2) ; v2(80.95,20.47) 82.85,18.58 v2(84.21,18.58)
DTR: length 20.7
  Top Layer w0.25: C18.1 83.91,9.44 v2(83.5,9.03) ; v2(71.47,10.39) 76.31,10.39 v2(76.98,9.71)
  Bottom Layer w0.25: 69.64,5.55 69.64,5.95 69.94,6.25 69.94,6.45 70.14,6.65 70.14,6.7 70.19,6.75 70.19,6.85 70.25,6.9 70.25,9.05 71.34,10.15 ; v2(76.98,9.71) 78.19,9.71 79.79,8.11 80.49,8.11 80.67,7.93 82.4,7.93 v2(83.5,9.03)
IPROPI_A: length 3.5
  Top Layer w0.25: U3.6 51.28,26.06 51.36,26.13 R14.1
IPROPI_B: length 3.3
  Top Layer w0.25: 98.08,17.68 98.08,15.66 97.59,15.17 R15.1
LEDA_D2: length 80.2
  Top Layer w0.25: U2.32 68.29,11.85 68.01,11.85 67.64,11.48 55.85,11.48 50.06,5.7 45.85,5.7 41.64,9.9 41.64,22.64 28.4,35.88 v2(13.16,35.88)
  Bottom Layer w0.25: v2(13.16,35.88) 13.11,35.93 12.37,35.93 R6.1
LEDB_D7: length 88.9
  Top Layer w0.25: 76.35,6.05 76.97,5.44 86.01,5.44 87.02,6.44 95.53,6.44 100.43,1.55 103.41,1.55 105.82,3.96 109.82,3.96 110.88,5.02 110.88,21.19 123.57,33.88 123.57,34.95 124.6,35.98 v2(135.06,35.98)
  Bottom Layer w0.25: R9.1 135.83,37.58 135.09,37.58 135.06,37.55 v2(135.06,35.98)
LEDC_D13: length 77
  Top Layer w0.25: v2(109.34,21.33) 108.55,21.33 100.62,13.41 97.22,13.41 v2(96.63,12.83) ; v2(87.26,36.67) 93.14,42.55 93.15,42.55 93.15,43.29 ; v2(79.54,9.79) 79.54,10.73 79.17,11.11 ; v2(81.88,8.61) 82.1,8.39 85.56,8.39 86.24,9.07 v2(86.24,9.27) ; v2(90.4,25.25) 90.4,24.97 v2(94.78,20.59)
  Bottom Layer w0.25: v2(87.26,36.67) 87.26,28.39 v2(90.4,25.25) ; v2(109.34,21.33) 108.58,22.1 J5.3 ; v2(79.54,9.79) 79.54,9.06 79.98,8.61 v2(81.88,8.61) ; v2(94.78,20.59) 96.63,18.74 v2(96.63,12.83) 94.32,10.51 93.66,10.51 92.58,11.59 88.57,11.59 v2(86.24,9.27)
MARK_L_A5: length 86.4
  Top Layer w0.25: v2(73.43,12.88) 71.79,12.88 71.28,13.38 ; v2(69.97,14.17) 69.12,15.02 v2(63.65,15.02) ; v2(47.06,15.73) 42.47,20.32 42.47,22.81 28.72,36.56 10.26,36.56 v2(9.44,35.75)
  Bottom Layer w0.25: R5.1 9.44,38.39 9.44,37.65 9.41,37.62 ; v2(63.65,15.02) 62.95,15.73 v2(47.06,15.73) ; 9.41,37.62 7.81,37.62 7.77,37.66 7.77,38.4 S1.4 ; 9.41,37.62 9.44,37.58 v2(9.44,35.75) ; v2(69.97,14.17) 69.97,15 70.31,15.34 70.96,15.34 v2(73.43,12.88)
MARK_R_A6: length 105.1
  Top Layer w0.25: v2(138.02,35.65) 137.28,35.65 135.93,37 135.93,37.1 138.07,39.24 ; v2(80.47,14.98) 80.47,15.77 89.75,25.05 89.75,33.47 96.64,40.35 99.22,40.35 100.23,41.36 100.23,45.23 102.32,47.32 106.49,47.32 113.95,39.86 137.45,39.86 138.07,39.24 ; 138.07,39.24 v2(146.77,39.24) ; v2(80.47,12.33) 79.59,12.33 78.92,13 78.8,13 U2.19
  Bottom Layer w0.25: v2(146.77,39.24) 146.77,38.4 S2.4 ; v2(80.47,12.33) v2(80.47,14.98) ; v2(138.02,35.65) R8.1
OUT_A1: length 22.3
  Top Layer w0.4: 49.98,23.42 49.98,25.27
  Top Layer w1.5: 49.98,25.27 47.6,25.27 47.6,34.52 M1.2
OUT_A2: length 23.8
  Top Layer w0.4: 49.6,15.9 49.78,15.9 50.63,16.75 U3.10
  Top Layer w1: 49.6,15.9 48.7,15.9
  Top Layer w1.5: 48.7,15.9 43.6,21 43.6,28.2 40.6,31.2 M1.1
OUT_B1: length 26.4
  Top Layer w0.4: U4.8 100.7,17.68
  Top Layer w1.5: M2.2 113.3,32.75 113.3,28.88 102.1,17.68 100.7,17.68
OUT_B2: length 20.1
  Top Layer w0.4: U4.10 98.73,24.42 99.28,24.97 99.8,24.97
  Top Layer w1: 99.8,24.97 102.5,24.97
  Top Layer w1.5: M2.1 106.1,35.29 106.1,28.57 102.5,24.97
OUT_C: length 14.6
  Top Layer w1: M3.2 101.6,30.66 101.6,40.11 Q1.3
  Bottom Layer w1: M3.2 D1.2
PWMA_D5: length 32.9
  Top Layer w0.25: v2(55.03,21.38) 54.53,21.88 U3.1 ; U2.9 74.55,5.59 v2(74.55,8.23) ; v2(70.69,14.69) 70.56,14.82 70.14,14.82 66.04,18.92 v2(56.52,18.92)
  Bottom Layer w0.25: v2(74.55,8.23) 74.55,10.82 v2(70.69,14.69) ; v2(56.52,18.92) 55.03,20.41 v2(55.03,21.38)
PWMB_D6: length 37.5
  Top Layer w0.25: v2(88.08,17.91) 83.95,17.91 81.87,15.83 v2(81.87,15.13) ; U2.10 76.48,4.79 v2(85.49,4.79) ; U4.1 94.19,18.32 v2(91.1,18.32)
  Bottom Layer w0.25: v2(85.49,4.79) 85.49,9.45 81.87,13.07 v2(81.87,15.13) ; v2(88.08,17.91) 89.41,19.23 90.18,19.23 v2(91.1,18.32)
PWMC_D10: length 49.2
  Top Layer w0.25: v2(94.69,43.17) 94.69,43.8 94.94,44.06 95.69,44.06 R16.1 ; v2(75.42,8.22) 77.57,8.22 78.05,7.75 ; v2(94.1,42.58) 86.54,35.02 86.54,22.63 79.46,15.55 v2(79.46,14.58)
  Bottom Layer w0.25: 79.22,14.5 78.12,13.4 76.03,13.4 75.92,13.3 75.82,13.3 75.53,13 75.53,10.6 ; v2(94.69,43.17) v2(94.1,42.58) ; 75.42,10.54 v2(75.42,8.22)
RESET: length 73.5
  Top Layer w0.25: v2(86.73,8.53) 86.89,8.69 86.89,9.54 85.86,10.56 85.28,10.56 ; 85.28,10.56 85.02,10.31 v2(81.87,10.31) ; 85.28,10.56 C18.2 ; v2(107.1,17.5) 102.22,12.62 102.22,3.24 ; 102.22,3.24 98.46,7 v2(86.65,7) ; 102.22,3.24 SW1.2 ; v2(77.29,10.78) 76.18,11.89 71.65,11.89 70.72,12.81 70.42,12.81 68.98,14.25 R10.2
  Bottom Layer w0.25: v2(77.29,10.78) 81.4,10.78 v2(81.87,10.31) ; J5.5 106.3,22.86 106.3,18.3 v2(107.1,17.5) ; v2(86.73,8.53) 86.73,7.08 v2(86.65,7)
RX_D0: length 68
  Top Layer w0.25: 70.15,12.25 71.37,11.03 v2(72.23,11.03) ; v2(84.9,29.24) 84.9,40.01 92.48,47.59 99.09,47.59 v2(100.02,46.67)
  Bottom Layer w0.25: J3.3 74.1,5.89 73.72,6.27 73.72,9.54 v2(72.23,11.03) 72.2,11.03 68.96,14.28 68.96,15.82 70.83,17.69 73.35,17.69 v2(84.9,29.24) ; R22.1 v2(100.02,46.67)
S0_A0: length 44.9
  Top Layer w0.25: U2.23 76.5,15.23 76.5,15.62 76.88,16 77.41,16 83.39,21.98 83.39,55.34 J2.8
S1_A1: length 43.6
  Top Layer w0.25: v2(82.66,29.62) 82.66,28.32 79.66,25.32 v2(79.66,22.92) ; 80.86,55.12 80.86,39.12 81.06,38.92 81.06,38.82 81.36,38.52 81.36,38.42 81.66,38.12 81.66,38.02 81.86,37.82 81.86,37.72 81.96,37.62 81.96,37.52 82.06,37.42 82.06,37.32 82.16,37.22 82.16,37.12 82.26,37.02 82.26,36.92 82.36,36.82 82.36,36.72 82.46,36.62 82.46,36.52 v2(82.66,36.32) ; v2(78.06,18.22) 78.06,18.12 76.06,16.12 76.06,16.02 75.96,15.92 75.96,15.82 75.76,15.62
  Bottom Layer w0.25: v2(78.06,18.22) 78.06,21.12 78.16,21.22 78.16,21.42 78.26,21.52 78.26,21.62 79.56,22.92 v2(79.66,22.92) ; v2(82.66,29.62) 83.16,30.12 83.16,33.92 83.06,34.02 83.06,34.62 82.96,34.72 82.96,35.12 82.86,35.22 82.86,35.52 82.76,35.62 82.76,35.82 82.66,35.92 v2(82.66,36.32)
S2_A2: length 47.9
  Top Layer w0.25: v2(69.93,22.93) 65.03,27.83 65.03,33.83 65.13,33.93 65.13,34.73 65.23,34.83 65.23,35.03 65.33,35.13 65.33,35.43 65.43,35.53 65.43,35.83 65.53,35.93 65.53,36.13 65.63,36.23 65.63,36.33 65.73,36.43 65.73,36.63 65.83,36.73 65.83,36.83 65.93,36.93 65.93,37.03 66.03,37.13 66.03,37.23 66.13,37.33 66.13,37.43 66.23,37.53 66.23,37.63 66.43,37.83 66.43,37.93 66.63,38.13 66.63,38.23 66.83,38.43 66.83,38.53 67.23,38.93 67.23,39.03 77.13,48.93 77.13,53.63 77.73,54.23 77.73,55.03 ; 72.43,15.63 70.23,17.83 v2(69.93,17.83)
  Bottom Layer w0.25: v2(69.93,22.93) v2(69.93,17.83)
S3_A3: length 49.4
  Top Layer w0.25: J2.5 64.45,44.82 64.45,21.85 69.67,16.62 70.31,16.62 U2.26
TX_D1: length 76
  Top Layer w0.25: 67.11,12.32 v2(67.11,13.59) ; 67.11,12.32 66.77,12.32 66.75,12.3 66.01,12.3 ; 67.11,12.32 68.95,12.32 U2.31 70.81,10.46 70.81,10.12 71.66,9.27 v2(72.92,9.27) ; v2(79.79,21.03) 77.36,18.6 68.64,18.6 v2(68.64,18.6) ; v2(97.52,42.24) 97.52,44.63 96.56,45.59 95.16,45.59 94.22,44.65 94.22,44.36 93.9,44.04 91.5,44.04 85.69,38.23 85.69,23.05 v2(84.5,21.86)
  Bottom Layer w0.25: v2(84.5,21.86) 80.62,21.86 v2(79.79,21.03) ; R20.1 99.27,40.37 97.52,42.12 v2(97.52,42.24) ; v2(67.11,13.59) 67.11,17.08 v2(68.64,18.6) ; J3.4 71.56,5.89 72.92,7.25 v2(72.92,9.27)
VCP_A: length 3.5
  Top Layer w0.25: U3.12 51.93,15.33 52.21,15.04 C11.2
VCP_B: length 3.4
  Top Layer w0.25: U4.12 97.43,24.2 96.22,25.42 96.13,25.42 96.13,26.21
VREF: length 61
  Top Layer w0.25: U4.5 97.43,16.73 96.7,16 95.5,16 94.96,15.45 94.96,14.24 ; 94.96,14.24 v2(90.91,14.24) ; 94.96,14.24 94.96,12.16 ; 94.96,12.16 R11.2 ; 94.96,12.16 R12.1 ; v2(52.59,25.4) 51.93,24.74 U3.5 ; v2(56.93,21.06) 64.57,21.06 69.65,15.98 v2(70.03,15.98)
  Bottom Layer w0.25: v2(52.59,25.4) v2(56.93,21.06) ; v2(70.03,15.98) 70.14,16.09 89.06,16.09 v2(90.91,14.24)
XTAL1: length 17.1
  Top Layer w0.25: C9.1 63.79,8.54 X1.1 63.84,5.39 63.94,5.39 64,5.34 64.04,5.34 64.09,5.29 64.14,5.29 64.19,5.24 64.25,5.24 64.29,5.19 64.39,5.19 64.44,5.14 64.5,5.14 64.54,5.09 64.59,5.09 64.64,5.04 64.69,5.04 64.75,4.99 64.79,4.99 64.84,4.94 64.94,4.94 65,4.89 65.04,4.89 65.09,4.84 65.14,4.84 65.19,4.79 65.25,4.79 65.29,4.74 65.34,4.74 65.39,4.69 65.5,4.69 65.54,4.64 65.59,4.64 65.64,4.59 65.69,4.59 65.75,4.54 65.79,4.54 65.84,4.49 65.89,4.49 65.94,4.44 66.04,4.44 66.09,4.39 66.14,4.39 66.19,4.34 66.25,4.34 66.69,3.89 66.75,3.89 66.79,3.84 70.69,3.84 70.75,3.89 72.75,3.89 72.79,3.94 72.89,3.94 73.94,4.99 73.94,5.04 74,5.09 74,5.19 74.04,5.24 74.04,5.49 74,5.54 74,5.64 73.94,5.69 73.94,5.74 73.69,5.99 73.34,5.99 73.29,5.94 73.14,5.94 73.09,5.89 73.04,5.89 72.79,5.64 72.75,5.64 72.59,5.49 72.44,5.49 U2.7
XTAL2: length 9.3
  Top Layer w0.25: 72.99,4.93 73,4.93 72.84,4.93 72.69,4.78 72.59,4.78 72.34,4.53 72.29,4.53 72.25,4.48 69.94,4.48 69.89,4.53 69.84,4.53 69.79,4.58 69.75,4.58 69.69,4.63 69.64,4.63 69.59,4.68 69.5,4.68 69.44,4.73 69.39,4.73 69.34,4.78 69.29,4.78 69.25,4.83 69.19,4.83 69.14,4.88 69.09,4.88 69.04,4.93 68.94,4.93 68.89,4.98 68.84,4.98 68.79,5.03 68.75,5.03 68.69,5.08 68.64,5.08 68.59,5.13 68.54,5.13 68.5,5.18 68.39,5.18 68.34,5.23 68.29,5.23 68.25,5.28 68.19,5.28 68.14,5.33 68.09,5.33 68.04,5.38 67.94,5.38 67.89,5.43 X1.2 67.88,5.44 67.88,6.04 67.83,6.09 67.83,7.04 67.03,7.84 67.03,7.89 66.98,7.94 66.98,8.04 66.93,8.09 66.93,8.14 66.88,8.19 66.88,8.24 66.83,8.29 66.83,8.34 66.78,8.39 66.78,8.49 66.73,8.54 C10.1
$1N2048: length 2.1
  Bottom Layer w0.25: R4.2 7.93,36.61 7.92,36.6 S1.1
$1N2069: length 7.6
  Bottom Layer w0.25: S2.1 144.13,38.06 143.86,38.06 143.44,37.64 140.34,37.64 140.27,37.72 140.27,38.39 R7.2
$1N2070: length 5.9
  Top Layer w0.25: LED1.2 50.29,45.96 50.29,46.7 50.61,47.01 52.37,47.01 53.42,45.95 R1.2
$1N2073: length 9.4
  Top Layer w0.25: v2(12.27,39.1) 12.05,39.1 10.72,37.78 7.57,37.78 7.05,38.3 LED2.2
  Bottom Layer w0.25: R6.2 12.37,38.93 12.27,39.03 v2(12.27,39.1)
$1N2082: length 8.4
  Top Layer w0.25: LED3.2 138.09,38.3 v2(136.82,37.04)
  Bottom Layer w0.25: v2(136.82,37.04) 136.6,36.82 R9.2
$1N2129: length 2.3
  Top Layer w0.25: LED4.2 93.75,46.1 93.71,46.1 93.15,45.54 93.15,44.8
$1N2130: length 3.5
  Top Layer w0.25: 64.41,12.3 63.67,12.3 63.66,12.3 R19.2
$1N2219: length 6.2
  Top Layer w0.25: Q1.1 95.69,41.57 ; 95.69,41.57 95.6,41.57 95.43,41.39 R17.1 ; 95.69,41.57 R16.2

## Copper pours and planes (outline as drawn; the poured copper is in the pictures)
GND on Top Layer: -2,60.6 150.2,60.6 150.2,-2 -2,-2
GND on Bottom Layer: -2,60.6 150.2,60.6 150.2,-2 -2,-2
